# Altium schematic sheet Power_Sheet.SchDoc
size 420 x 297 mm; SheetNumber: 2; SheetTotal: 5
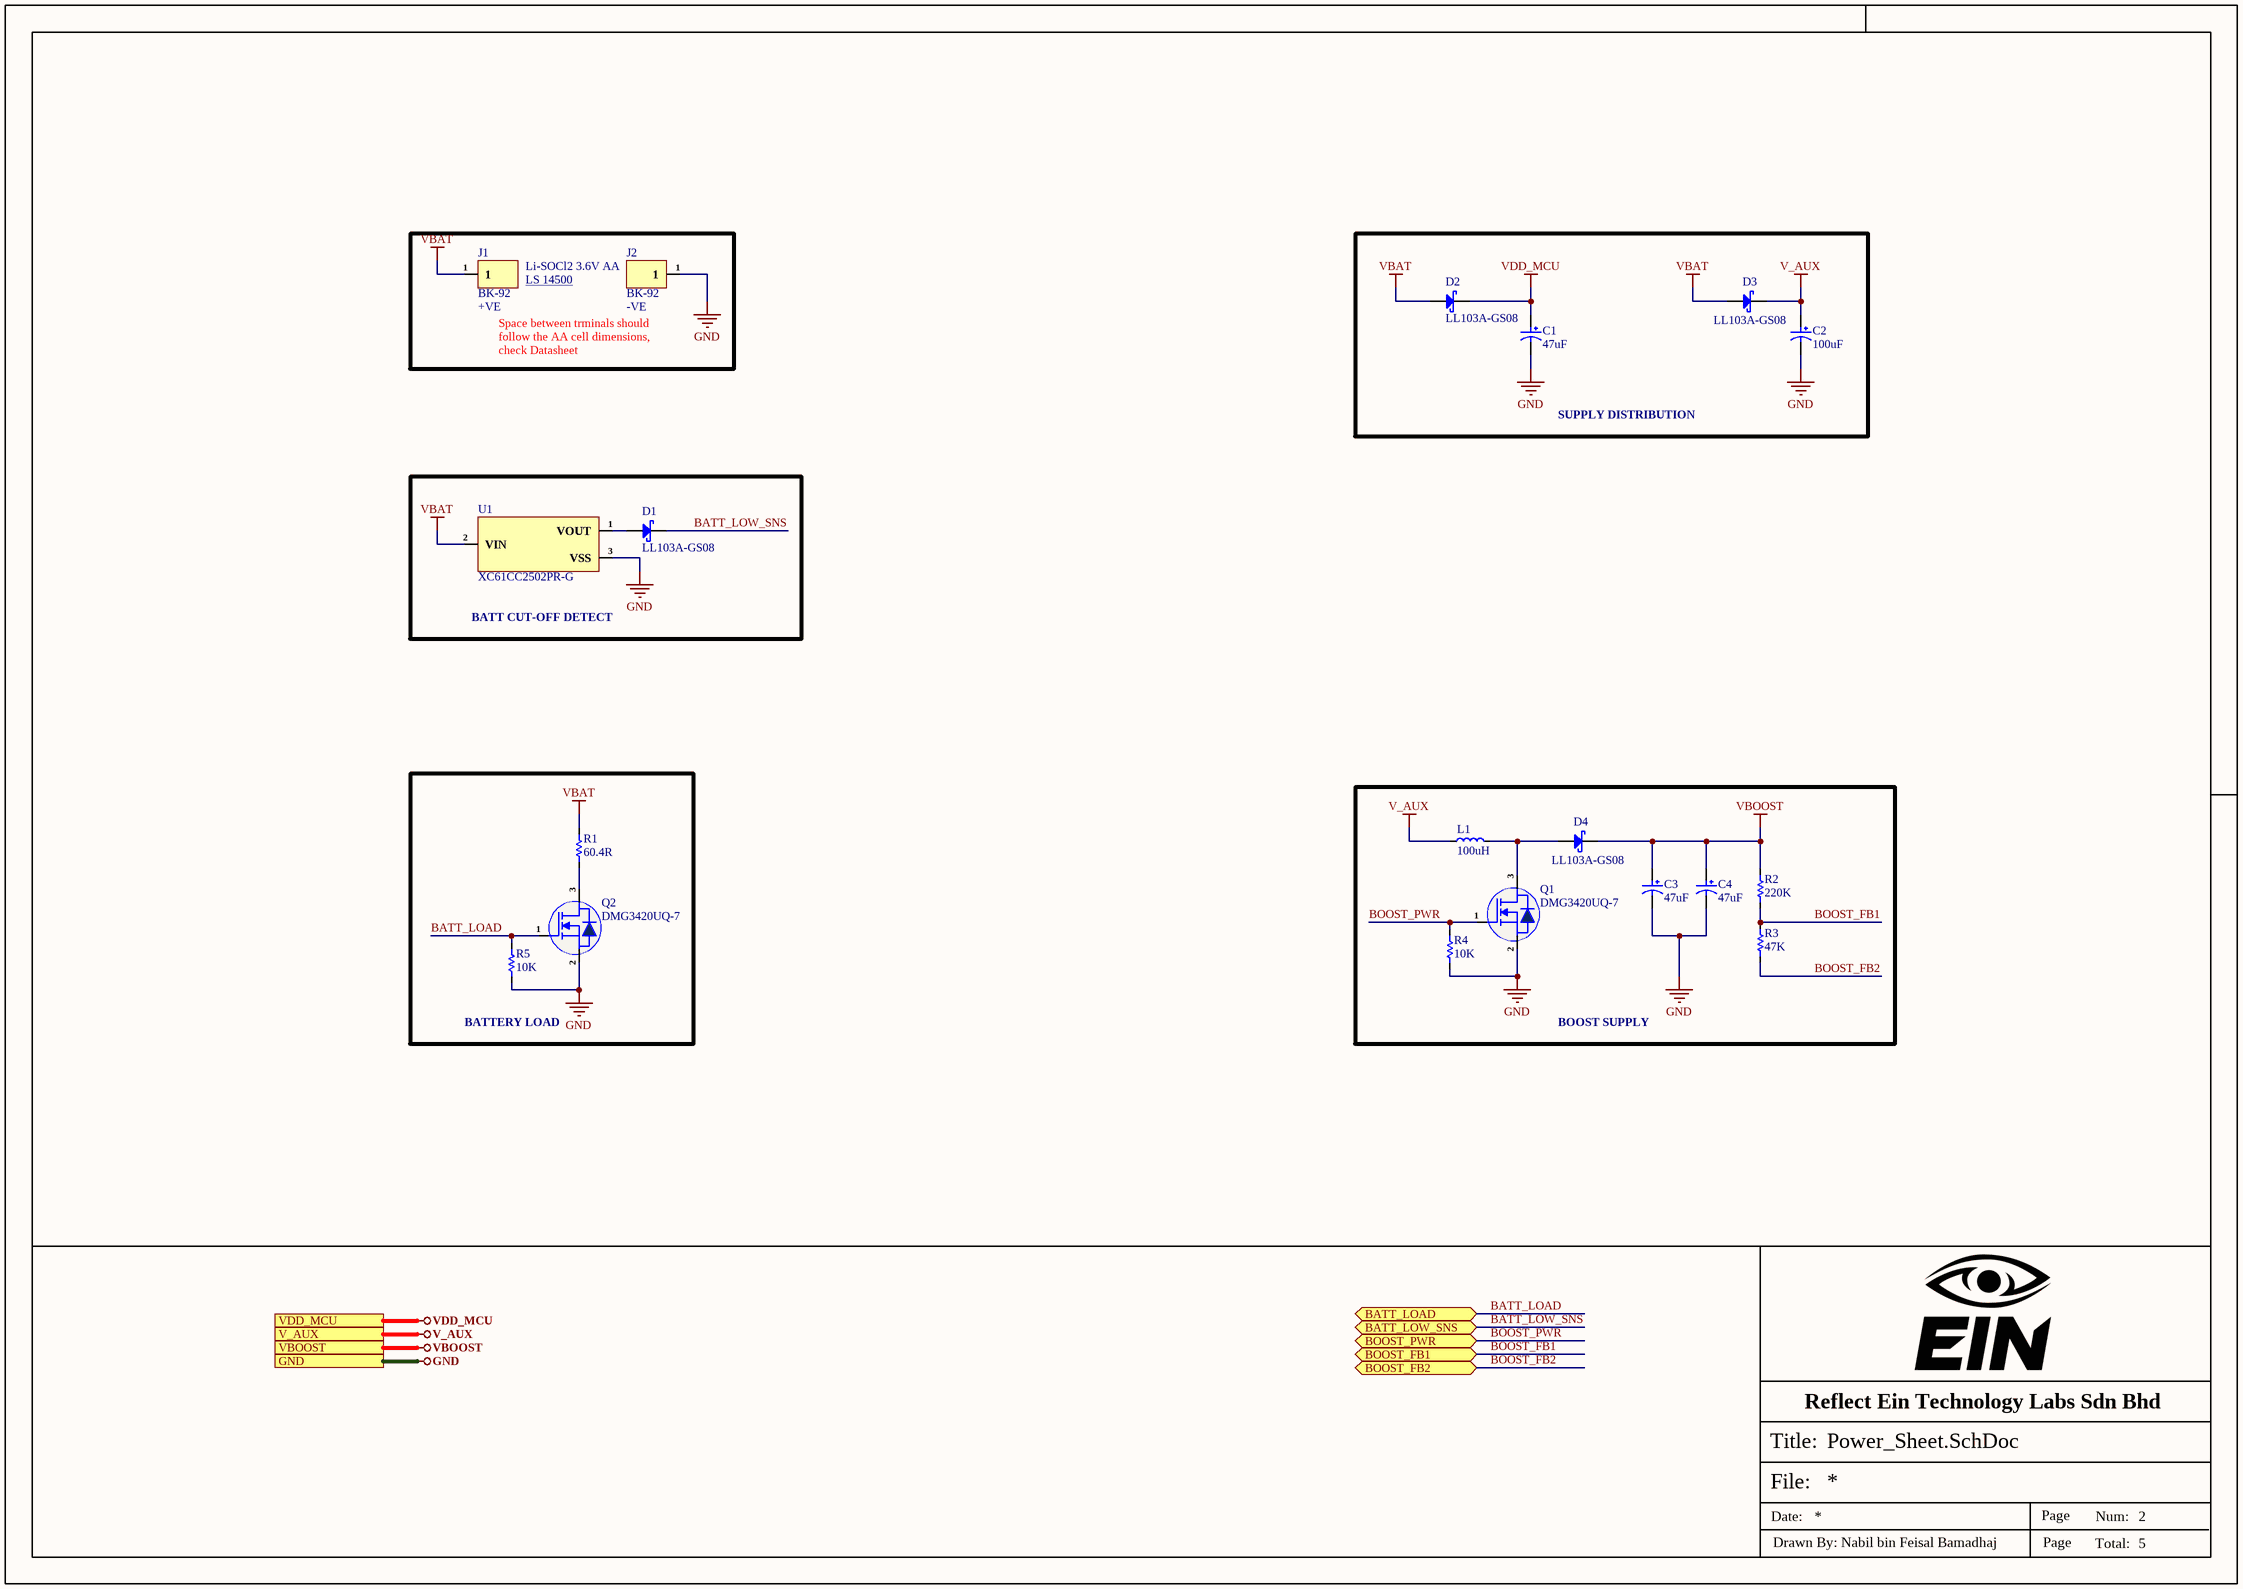
[diagram p0: Power_Sheet.SchDoc]

## Parts
C1  47uF  [Case-C]
C2  100uF  [Case-D]
C3  47uF  [Case-C]
C4  47uF  [Case-C]
D1  LL103A-GS08  [LL-34]
D2  LL103A-GS08  [LL-34]
D3  LL103A-GS08  [LL-34]
D4  LL103A-GS08  [LL-34]
J1  BK-92  [BK-92]
J2  BK-92  [BK-92]
L1  100uH  [NLV32T-101J-EF]
Q1  DMG3420UQ-7  [SOT-23]
Q2  DMG3420UQ-7  [SOT-23]
R1  60.4R  [Res-1206]
R2  220K  [Res-1206]
R3  47K  [Res-1206]
R4  10K  [Res-1206]
R5  10K  [Res-1206]
U1  XC61CC2502PR-G  [SOT-89-3]

## Blocks framed on the sheet
SUPPLY DISTRIBUTION: C1 C2 D2 D3
BATT CUT-OFF DETECT: D1 U1
BATTERY LOAD: Q2 R1 R5
BOOST SUPPLY: C3 C4 D4 L1 Q1 R2-R4

## Ports
BATT_LOAD (bidir, see Top-Sheet[2B], Controller_Sheet[4D]), BATT_LOW_SNS (bidir, see Top-Sheet[2B], Controller_Sheet[4D]), BOOST_FB1 (bidir, see Top-Sheet[2B], Controller_Sheet[4D]), BOOST_FB2 (bidir, see Top-Sheet[2B], Controller_Sheet[4D]), BOOST_PWR (bidir, see Top-Sheet[2B], Controller_Sheet[4D]), GND (see Top-Sheet[2B], Connector_Sheet[1D], Controller_Sheet[1D], Peripheral_Sheet[1D]), V_AUX (see Top-Sheet[2A], Connector_Sheet[1D], Peripheral_Sheet[1D]), VBOOST (see Top-Sheet[2B], Peripheral_Sheet[1D]), VDD_MCU (see Top-Sheet[2A], Controller_Sheet[1D], Peripheral_Sheet[1D])

## Nets
GND: C1.2 C2.2 C3.2 C4.2 J2.1 Q1.2(S) Q2.2(S) R4.1 R5.1 U1.3(VSS) ; port GND
V_AUX: C2.1 D3.1(K) L1.1 ; port V_AUX
VBAT: D2.2(A) D3.2(A) J1.1 R1.2 U1.2(VIN)
VBOOST: C3.1 C4.1 D4.1(K) R2.2 ; port VBOOST
VDD_MCU: C1.1 D2.1(K) ; port VDD_MCU
BATT_LOAD: Q2.1(G) R5.2 ; port BATT_LOAD
BATT_LOW_SNS: D1.1(K) ; port BATT_LOW_SNS
BOOST_FB1: R2.1 R3.2 ; port BOOST_FB1
BOOST_FB2: R3.1 ; port BOOST_FB2
BOOST_PWR: Q1.1(G) R4.2 ; port BOOST_PWR
NetD1_2: D1.2(A) U1.1(VOUT)
NetD4_2: D4.2(A) L1.2 Q1.3(D)
NetQ2_3: Q2.3(D) R1.1

## Notes on the sheet
- (near J1) +VE
- Li-SOCl2 3.6V AA
- (near J1) LS 14500 <https://uk.rs-online.com/web/p/aa-batteries/2019438>
- (near J2) -VE
- Space between trminals should follow the AA cell dimensions, check Datasheet
- Reflect Ein Technology Labs Sdn Bhd
- File:
- Title:
- Date:
- Page
- Num:
- Total:
- Drawn By: Nabil bin Feisal Bamadhaj

## Library data of the parts
C1 C3 C4 = 293D476X9016C2TE3: CAP TANT 47UF 10% 16V 2312; Manufacturer: Vishay Sprague; Item Type: Capacitors; Supplier: Mouser; LCSC Part Number: C129697; Manufacturer Part Number: 293D476X9016C2TE3; RoHS: Yes; Stock: 4282; Pricing: 1=0.47, 10=0.301, 50=0.301, 100=0.262, 1000=0.188, 10000=0.188 (USD); ComponentLink1URL: https://datasheet.ciiva.com/11793/0900766b80d97b37-11793330.pdf?src-supplier=Rs; ComponentLink1Description: https://datasheet.ciiva.com/11793/0900766b80d97b37-11793330.pdf?src-supplier=Rs; ComponentLink2URL: https://datasheet.ciiva.com/16305/293d-16305383.pdf?src-supplier=Future+Electronics; ComponentLink2Description: https://datasheet.ciiva.com/16305/293d-16305383.pdf?src-supplier=Future+Electronics; ComponentLink3URL: https://datasheet.ciiva.com/22695/438417-22695173.pdf?src-supplier=Element14; ComponentLink3Description: https://datasheet.ciiva.com/22695/438417-22695173.pdf?src-supplier=Element14; ComponentLink4URL: https://datasheet.ciiva.com/3004/293d-3004007.pdf?src-supplier=Avnet; ComponentLink4Description: https://datasheet.ciiva.com/3004/293d-3004007.pdf?src-supplier=Avnet; ComponentLink5URL: https://datasheet.ciiva.com/12910/293d-239871-12910805.pdf?src-supplier=Mouser; ComponentLink5Description: https://datasheet.ciiva.com/12910/293d-239871-12910805.pdf?src-supplier=Mouser; ComponentLink6URL: https://datasheet.ciiva.com/259/293d-259267.pdf?src-supplier=Digikey; ComponentLink6Description: https://datasheet.ciiva.com/259/293d-259267.pdf?src-supplier=Digikey; ComponentLink7URL: https://datasheet.ciiva.com/259/293d-259268.pdf?src-supplier=Digikey; ComponentLink7Description: https://datasheet.ciiva.com/259/293d-259268.pdf?src-supplier=Digikey; ComponentLink8URL: https://datasheet.ciiva.com/259/293d-259269.pdf?src-supplier=Digikey; ComponentLink8Description: https://datasheet.ciiva.com/259/293d-259269.pdf?src-supplier=Digikey; ComponentLink9URL: https://datasheet.ciiva.com/18710/293d-eng-18710842.pdf?src-supplier=Distrelec; ComponentLink9Description: https://datasheet.ciiva.com/18710/293d-eng-18710842.pdf?src-supplier=Distrelec; ComponentLink10URL: https://datasheet.ciiva.com/29244/455699-da-01-en-smd-kondensator-293d476x9016c2te3-500-st-29244151.pdf?src-supplier=Conrad; ComponentLink10Description: https://datasheet.ciiva.com/29244/455699-da-01-en-smd-kondensator-293d476x9016c2te3-500-st-29244151.pdf?src-supplier=Conrad
C2 = 293D107X9010D2TE3: CAP TANT 100UF 10% 10V 2917; Manufacturer: Vishay Sprague; Item Type: Capacitors; Dielectric Material: Tantalum; ESR (Equivalent Series Resistance): 600mR; Ripple Current: 350mA; Leakage Current: 10uA; Polarity: Polar; Dissipation Factor: 8%; Power Rating: 100mW; Q Factor: 8NUMBER; Supplier: Mouser; LCSC Part Number: C155463; Manufacturer Part Number: 293D107X9010D2TE3; RoHS: Yes; Stock: 119578; Pricing: 1=1.06, 10=0.468, 50=0.468, 100=0.38, 1000=0.265, 10000=0.258 (USD); Mounting Technology: Surface Mount,PCB; Case/Package: 2917; Case Code (Imperial): 2917; Case Code (Metric): 7343; Min Operating Temperature: -55°C; Max Operating Temperature: 125°C; Value: 100uF; Packaging: Tape and Reel; Tolerance: 10%; Voltage Rating: 10V; Voltage Rating (DC): 10V; Package Quantity: 500; Termination: SMD/SMT; Voltage: 10V; Features: General Purpose; Series: TANTAMOUNT®, 293D; Construction: Flat; Length: 7.3mm; Width: 2.8mm; Height: 2.8mm; Depth: 4.3mm; Radiation Hardening: No; Lead Free: Lead Free; RoHS Compliant: Yes; Reach SVHC Compliant: Unknown; ComponentLink1URL: https://datasheet.ciiva.com/1463/438417-1463240.pdf?src-supplier=Element14; ComponentLink1Description: https://datasheet.ciiva.com/1463/438417-1463240.pdf?src-supplier=Element14; ComponentLink2URL: https://datasheet.ciiva.com/22695/438417-22695119.pdf?src-supplier=Element14; ComponentLink2Description: https://datasheet.ciiva.com/22695/438417-22695119.pdf?src-supplier=Element14; ComponentLink3URL: https://datasheet.ciiva.com/3003/293d-3003852.pdf?src-supplier=Avnet; ComponentLink3Description: https://datasheet.ciiva.com/3003/293d-3003852.pdf?src-supplier=Avnet; ComponentLink4URL: https://datasheet.ciiva.com/16366/293d-16366280.pdf?src-supplier=Future+Electronics; ComponentLink4Description: https://datasheet.ciiva.com/16366/293d-16366280.pdf?src-supplier=Future+Electronics; ComponentLink5URL: https://datasheet.ciiva.com/15163/getdatasheetpartid-87118-15163221.pdf?src-supplier=Verical; ComponentLink5Description: https://datasheet.ciiva.com/15163/getdatasheetpartid-87118-15163221.pdf?src-supplier=Verical
D1-D4 = LL103A-GS08: DIODE SCHOTTKY 40V 200MA SOD80; Manufacturer: Vishay; Item Type: Schottky Diodes; Body Material: Glass; Value: 50pF; Current Rating: 400A; Element Configuration: Single; Forward Voltage: 370mV; Max Forward Surge Current (Ifsm): 15A; Max Junction Temperature (Tj): 125°C; Max Power Dissipation: 400mW; Max Reverse Leakage Current: 5µA; Number of Elements: 1; Recovery Time: 10ns; Supplier: Avnet; LCSC Part Number: C2979792; Manufacturer Part Number: LL103A-GS08; RoHS: Compliant; Stock: 37500; Pricing: 12500=0.05045 (USD); Average Rectified Current: 200mA; China RoHS: Non-Compliant; Contact Plating: Silver, Tin; Diameter: 1.6mm; Forward Current: 200mA; Height: 1.6mm; Lead Free: Lead Free; Length: 3.7mm; Lifecycle Status: Production; Max Operating Temperature: 125°C; Max Output current: 200mA; Max Repetitive Reverse Voltage (Vrrm): 40V; Max Reverse Voltage (DC): 40V; Max Surge Current: 15A; Min Operating Temperature: -65°C; Mounting Technology: Surface Mount; Pins: 2; Number of Terminals: 2; Packaging: Cut Tape; Peak Non-Repetitive Surge Current: 15A; Peak Reverse Current: 5µA; Power Dissipation: 400mW; Radiation Hardening: No; REACH SVHC: Yes; Reverse Recovery Time: 10ns; Reverse Standoff Voltage: 40V; Reverse Voltage: 40V; Schedule B: 8541100070, 8541100070|8541100070|8541100070|8541100070|8541100070; Width: 1.6mm; ComponentLink1URL: https://datasheet.octopart.com:443/LL103A-GS08-Vishay-datasheet-181469840.pdf?src-supplier=Farnell; ComponentLink1Description: https://datasheet.octopart.com:443/LL103A-GS08-Vishay-datasheet-181469840.pdf?src-supplier=Farnell; ComponentLink2URL: https://datasheet.octopart.com:443/LL103A-GS08-Vishay-datasheet-10540872.pdf?src-supplier=Farnell; ComponentLink2Description: https://datasheet.octopart.com:443/LL103A-GS08-Vishay-datasheet-10540872.pdf?src-supplier=Farnell; ComponentLink3URL: https://datasheet.octopart.com:443/LL103A-GS08-Vishay-datasheet-8365623.pdf?src-supplier=Farnell; ComponentLink3Description: https://datasheet.octopart.com:443/LL103A-GS08-Vishay-datasheet-8365623.pdf?src-supplier=Farnell; ComponentLink4URL: https://datasheet.octopart.com:443/LL103A-GS08-Vishay-datasheet-11751478.pdf?src-supplier=_legacy+Avnet; ComponentLink4Description: https://datasheet.octopart.com:443/LL103A-GS08-Vishay-datasheet-11751478.pdf?src-supplier=_legacy+Avnet; ComponentLink5URL: https://datasheet.octopart.com:443/LL103A-GS08-Vishay-datasheet-181483661.pdf?src-supplier=IHS; ComponentLink5Description: https://datasheet.octopart.com:443/LL103A-GS08-Vishay-datasheet-181483661.pdf?src-supplier=IHS; ComponentLink6URL: https://datasheet.octopart.com:443/LL103A-GS08-Vishay-datasheet-62318247.pdf?src-supplier=Newark; ComponentLink6Description: https://datasheet.octopart.com:443/LL103A-GS08-Vishay-datasheet-62318247.pdf?src-supplier=Newark; ComponentLink7URL: https://datasheet.octopart.com:443/LL103A-GS08.-Vishay-datasheet-184398164.pdf?src-supplier=Newark; ComponentLink7Description: https://datasheet.octopart.com:443/LL103A-GS08.-Vishay-datasheet-184398164.pdf?src-supplier=Newark; ComponentLink8URL: https://datasheet.octopart.com:443/LL103A-GS08-Vishay-datasheet-21268782.pdf?src-supplier=Newark; ComponentLink8Description: https://datasheet.octopart.com:443/LL103A-GS08-Vishay-datasheet-21268782.pdf?src-supplier=Newark; ComponentLink9URL: https://datasheet.octopart.com:443/LL103A-GS08-Vishay-datasheet-7183.pdf?src-supplier=Newark; ComponentLink9Description: https://datasheet.octopart.com:443/LL103A-GS08-Vishay-datasheet-7183.pdf?src-supplier=Newark; ComponentLink10URL: https://datasheet.octopart.com:443/LL103A-GS08-Vishay-datasheet-5392692.pdf?src-supplier=element14; ComponentLink10Description: https://datasheet.octopart.com:443/LL103A-GS08-Vishay-datasheet-5392692.pdf?src-supplier=element14; ComponentLink11URL: https://datasheet.octopart.com:443/LL103A-GS08-Vishay-datasheet-159617103.pdf?src-supplier=element14+APAC; ComponentLink11Description: https://datasheet.octopart.com:443/LL103A-GS08-Vishay-datasheet-159617103.pdf?src-supplier=element14+APAC; ComponentLink12URL: https://datasheet.octopart.com:443/LL103A-GS08-Vishay-datasheet-42424840.pdf?src-supplier=TME; ComponentLink12Description: https://datasheet.octopart.com:443/LL103A-GS08-Vishay-datasheet-42424840.pdf?src-supplier=TME; ComponentLink13URL: https://datasheet.octopart.com:443/LL103A-GS08-Vishay-datasheet-14186831.pdf?src-supplier=iiiC; ComponentLink13Description: https://datasheet.octopart.com:443/LL103A-GS08-Vishay-datasheet-14186831.pdf?src-supplier=iiiC; ComponentLink14URL: https://datasheet.octopart.com:443/LL103A-GS08-Vishay-datasheet-10014030.pdf?src-supplier=RS+(Formerly+Allied+Electronics); ComponentLink14Description: https://datasheet.octopart.com:443/LL103A-GS08-Vishay-datasheet-10014030.pdf?src-supplier=RS+(Formerly+Allied+Electronics); ComponentLink15URL: https://datasheet.octopart.com:443/LL103A-GS08-Vishay-datasheet-72214.pdf?src-supplier=RS+(Formerly+Allied+Electronics); ComponentLink15Description: https://datasheet.octopart.com:443/LL103A-GS08-Vishay-datasheet-72214.pdf?src-supplier=RS+(Formerly+Allied+Electronics); ComponentLink16URL: http://sigma.octopart.com:80/rohs_statement/Vishay-company-15.pdf?src-supplier=Compliance+Statements; ComponentLink16Description: http://sigma.octopart.com:80/rohs_statement/Vishay-company-15.pdf?src-supplier=Compliance+Statements
J1 J2 = BK-92: BATTERY CONTACT CLIP AA PC PIN; Manufacturer: Memory Protection Devices; Item Type: Battery Holder; Number of Cells: 1; Supplier: Digikey; Manufacturer Part Number: BK-92; RoHS: Yes; Stock: 124155; Pricing: 1=0.43, 10=0.353, 50=0.3104, 100=0.2934, 250=0.27248, 500=0.25762, 1000=0.24358, 2500=0.2262, 5000=0.21387 (USD); Mounting Technology: Through Hole,PCB; Series: -; Termination: PC Pin; ComponentLink1URL: https://datasheet.ciiva.com/4/bk-92-datasheet-4254.pdf?src-supplier=Digikey; ComponentLink1Description: https://datasheet.ciiva.com/4/bk-92-datasheet-4254.pdf?src-supplier=Digikey
L1 = NLV32T-101J-EF: FIXED IND 100UH 40MA 10 OHM SMD; Manufacturer: TDK; Item Type: Inductors; Core Material: Ferrite; Tolerance: 5%; Shielding: Unshielded; DC Resistance (DCR): 10R; Self Resonant Frequency: 10MHz; Test Frequency: 796kHz; Q Factor: 20; Supplier: Mouser; LCSC Part Number: C295124; Manufacturer Part Number: NLV32T-101J-EF; RoHS: Yes; Stock: 17406; Pricing: 1=0.22, 10=0.113, 50=0.113, 100=0.103, 1000=0.1, 10000=0.067 (USD); Mounting Technology: Surface Mount; Case/Package: 1210; Case Code (Metric): 3225; Case Code (Imperial): 1210; Weight: 0.001764oz; Min Operating Temperature: -40°C; Max Operating Temperature: 105°C; Package Quantity: 2000; Packaging: Tape and Reel; Current Rating: 40mA; Value: 100uH; Termination: SMD/SMT; Max DC Current: 40mA; Series: NLV-EF; Length: 0.126inch; Width: 0.098inch; Height: 2.2mm; Height - Seated (Max): 0.094inch; RoHS Compliant: Yes; Lead Free: Lead Free; ComponentLink1URL: http://www.mouser.com/ds/2/400/nductor_automotive_standard_nlv32-pfd_en-785075.pdf?src-supplier=Mouser; ComponentLink1Description: http://www.mouser.com/ds/2/400/nductor_automotive_standard_nlv32-pfd_en-785075.pdf?src-supplier=Mouser; ComponentLink2URL: https://product.tdk.com/info/en/catalog/datasheets/inductor_commercial_standard_nlv32-ef_en.pdf?src-supplier=Digikey; ComponentLink2Description: https://product.tdk.com/info/en/catalog/datasheets/inductor_commercial_standard_nlv32-ef_en.pdf?src-supplier=Digikey; ComponentLink3URL: https://product.tdk.com/info/en/catalog/datasheets/inductor_commercial_standard_nlv32-ef_en.pdf?ref_disty=digikey&src-supplier=Digikey; ComponentLink3Description: https://product.tdk.com/info/en/catalog/datasheets/inductor_commercial_standard_nlv32-ef_en.pdf?ref_disty=digikey&src-supplier=Digikey
Q1 Q2 = DMG3420UQ-7: MOSFET BVDSS: 8V~24V SOT23 T&R 3; Manufacturer: Diodes; Item Type: MOSFETs; Supplier: Digikey; LCSC Part Number: C5157847; Manufacturer Part Number: DMG3420UQ-7; RoHS: Yes; Stock: 5879; Pricing: 1=0.45, 10=0.276, 100=0.1748, 500=0.1308, 1000=0.11658 (USD); RoHS Compliant: Yes
R1 = AC1206FR-0760R4L: RES SMD 60.4 OHM 1% 1/4W 1206; Manufacturer: Yageo; Item Type: Resistors; Power Rating: 250mW; Voltage Rating: 200V; Temperature Coefficient: 100ppm/°C; Supplier: Future Electronics; LCSC Part Number: C144481; Manufacturer Part Number: AC1206FR-0760R4L; RoHS: Yes; Stock: 335000; Pricing: 5000=0.005, 20000=0.0048, 50000=0.0047, 125000=0.0045, 200000=0.0043 (USD); Case/Package: 1206; Case Code (Imperial): 1206; Case Code (Metric): 3216; Min Operating Temperature: -55°C; Max Operating Temperature: 155°C; Value: 60.4R; Tolerance: 1%; Packaging: Tape and Reel; Package Quantity: 1; Termination: SMD/SMT; Number of Terminations: 2; Max Power Dissipation: 250mW; Features: Moisture Resistant,Automotive AEC-Q200,Anti-Sulfur; Series: AC; Length: 0.122inch; Width: 0.063inch; Height: 0.026inch; Lead Free: Lead Free; RoHS Compliant: Yes; ComponentLink1URL: http://www.mouser.com/ds/2/447/yageodocoutput-1111992.pdf?src-supplier=Mouser; ComponentLink1Description: http://www.mouser.com/ds/2/447/yageodocoutput-1111992.pdf?src-supplier=Mouser; ComponentLink2URL: https://datasheet.octopart.com/AC1206FR-0760R4L-Yageo-datasheet-166720450.pdf?src-supplier=Future+Electronics; ComponentLink2Description: https://datasheet.octopart.com/AC1206FR-0760R4L-Yageo-datasheet-166720450.pdf?src-supplier=Future+Electronics; ComponentLink3URL: http://www.yageo.com/NewPortal/yageodocoutput?fileName=/pdf/R-Chip/PYu-AC_51_RoHS_L_6.pdf&src-supplier=Digikey; ComponentLink3Description: http://www.yageo.com/NewPortal/yageodocoutput?fileName=/pdf/R-Chip/PYu-AC_51_RoHS_L_6.pdf&src-supplier=Digikey; ComponentLink4URL: http://www.yageo.com/documents/recent/PYu-AC_51_RoHS_L_2_revised.pdf?src-supplier=Future+Electronics; ComponentLink4Description: http://www.yageo.com/documents/recent/PYu-AC_51_RoHS_L_2_revised.pdf?src-supplier=Future+Electronics
R2 = RT1206BRD07220KL: RES SMD 220K OHM 0.1% 1/4W 1206; Manufacturer: Yageo; Item Type: Resistors; Voltage Rating (DC): 200V; Supplier: Digikey; LCSC Part Number: C309663; Manufacturer Part Number: RT1206BRD07220KL; RoHS: Yes; Stock: 10004; Pricing: 1=0.34, 10=0.225, 50=0.1816, 100=0.1663, 500=0.1326, 1000=0.11628 (USD); Lead Free: 5697LeadFree; ComponentLink1URL: https://datasheet.ciiva.com/2587/pyu-rt-1-to-0-05-rohs-l-5-2587527.pdf?src-supplier=Digikey; ComponentLink1Description: https://datasheet.ciiva.com/2587/pyu-rt-1-to-0-05-rohs-l-5-2587527.pdf?src-supplier=Digikey
R3 = ARG06BTC4702: 250mW Thin Film Resistor 200V ±25ppm/℃ ±0.1% 47kΩ 1206 Chip Resistor - Surface Mount ROHS; Manufacturer: Viking Tech; Manufacturer Part Number: ARG06BTC4702; Package: 1206; LCSC Part Number: C2828891; Item Type: Resistor; ComponentLink1Description: LCSC; ComponentLink1URL: https://www.lcsc.com/product-detail/Chip-Resistor-Surface-Mount_Viking-Tech-ARG06BTC4702_C2828891.html
R4 R5 = AC1206FR-7W10KL: RES 10K OHM 1% 1/2W 1206; Manufacturer: Yageo; Item Type: Resistors; Value: 10kR; Supplier: Mouser; LCSC Part Number: C326700; Manufacturer Part Number: AC1206FR-7W10KL; RoHS: No; Stock: 10222; Pricing: 1=0.14, 10=0.052, 50=0.052, 100=0.029, 1000=0.018, 10000=0.011 (USD); Case/Package: 340Case; Packaging: 10Packaging
U1 = XC61CC2502PR-G: Supervisory Circuits; Manufacturer: Torex; Item Type: IC; Manufacturer Part Number: XC61CC2502PR-G; Package: SOT-89; LCSC Part Number: -; ComponentLink1Description: Torex; ComponentLink1URL: https://direct.torexsemi.com/en-us/product/xc61c/xc61cc2502pr-g